# Altium schematic sheet Sheet.SchDoc
size A
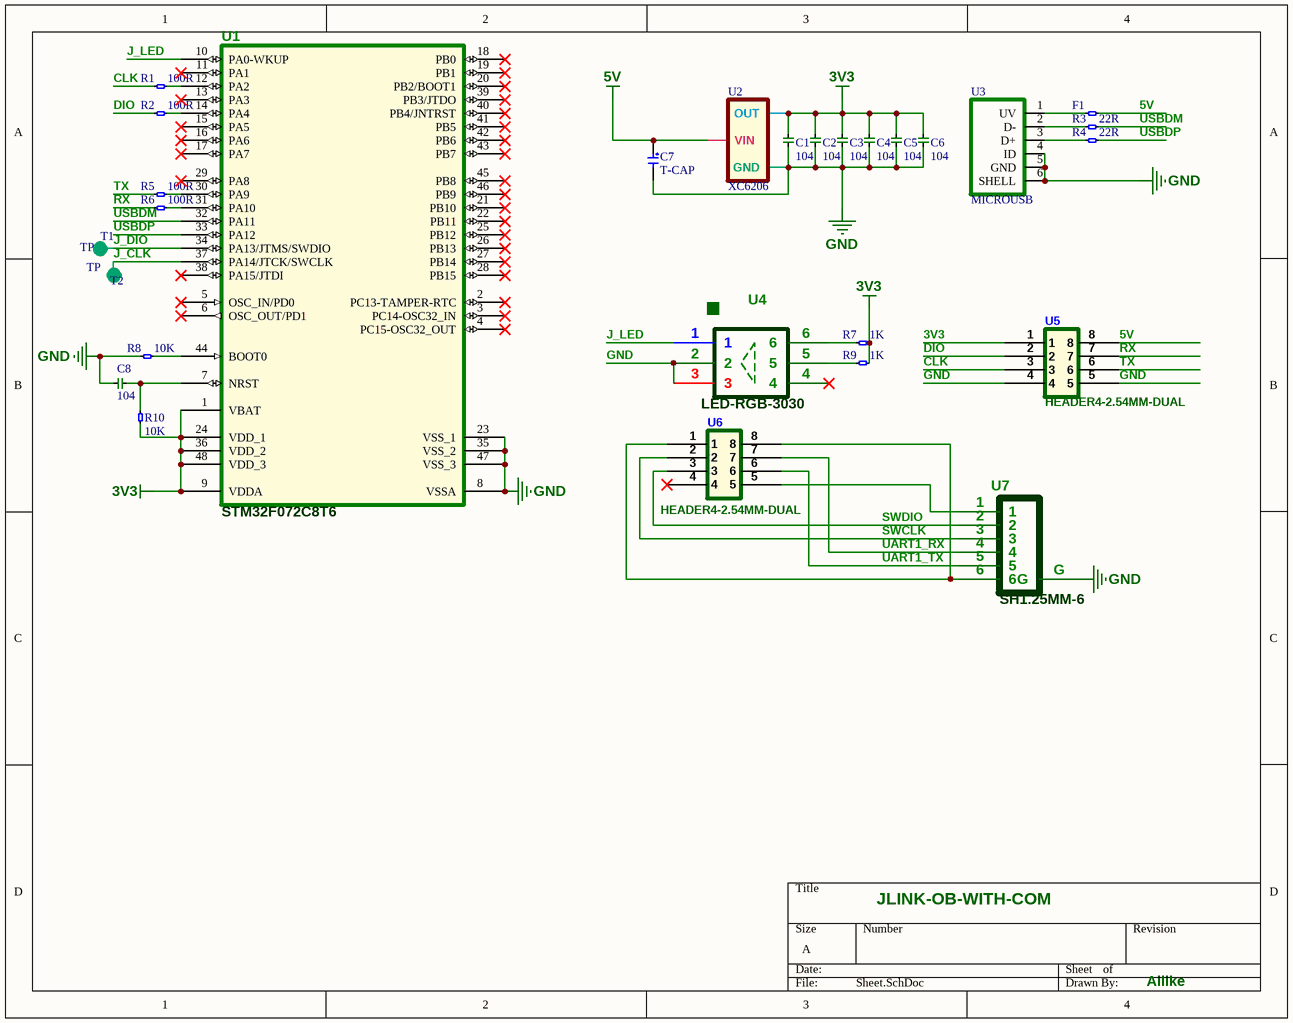
[diagram p0: Sheet.SchDoc]

## Parts
C1  104  [C0603]
C2  104  [C0603]
C3  104  [C0603]
C4  104  [C0603]
C5  104  [C0603]
C6  104  [C0603]
C7  T-CAP  [T-CAP-1206]
C8  104  [C0603]
F1  ?R  [R0603]  (value not drawn)
R1  100R  [R0603]
R2  100R  [R0603]
R3  22R  [R0603]
R4  22R  [R0603]
R5  100R  [R0603]
R6  100R  [R0603]
R7  1K  [R0603]
R8  10K  [R0603]
R9  1K  [R0603]
R10  10K  [R0603]
T1  TP  [TP]
T2  TP  [TP]
U1  STM32F072C8T6  [LQFP48P]
U2  XC6206  [XC6206]
U3  MICROUSB  [MICROUSB-DIP]
U4  LED-RGB-3030  [LED-RGB-PLCC6(3030)]
U5  HEADER4-2.54MM-DUAL  [HEADER4-2.54MM-BOTH]
U6  HEADER4-2.54MM-DUAL  [HEADER4-2.54MM-BOTH]
U7  SH1.25MM-6  [SH1.25MM-6PIN-VER]

## Nets
3V3: C1.2 C2.2 C3.2 C4.2 C5.2 C6.2 R7.2 R9.2 R10.1 U1.1(VBAT) U1.9(VDDA) U1.24(VDD_1) U1.36(VDD_2) U1.48(VDD_3) U2.3(OUT) U5.1
5V: C7.1 F1.2 U2.1(VIN) U5.8
GND: C1.1 C2.1 C3.1 C4.1 C5.1 C6.1 C7.2 C8.1 R8.1 U1.8(VSSA) U1.23(VSS_1) U1.35(VSS_2) U1.47(VSS_3) U2.2(GND) U3.4(ID) U3.5(GND) U3.6(SHELL) U4.2 U4.3 U5.4 U5.5 U7.G
CLK: R1.1 U5.3
DIO: R2.1 U5.2
J_CLK: T2.1 U1.37(PA14/JTCK/SWCLK)
J_DIO: T1.1 U1.34(PA13/JTMS/SWDIO)
J_LED: U1.10(PA0-WKUP) U4.1
RX: R6.1 U5.7
SWCLK: U6.2 U7.3
SWDIO: U6.3 U7.2
TX: R5.1 U5.6
UART1_RX: U6.7 U7.4
UART1_TX: U6.6 U7.5
USBDM: R3.2 U1.32(PA11)
USBDP: R4.2 U1.33(PA12)
NetC8_2: C8.2 R10.2 U1.7(NRST)
NetF1_1: F1.1 U3.1(UV)
NetR1_2: R1.2 U1.12(PA2)
NetR2_2: R2.2 U1.14(PA4)
NetR3_1: R3.1 U3.2(D-)
NetR4_1: R4.1 U3.3(D+)
NetR5_2: R5.2 U1.30(PA9)
NetR6_2: R6.2 U1.31(PA10)
NetR7_1: R7.1 U4.6
NetR8_2: R8.2 U1.44(BOOT0)
NetR9_1: R9.1 U4.5
NetU6_1: U6.1 U6.8 U7.6
NetU6_5: U6.5 U7.1

Not connected (* = marked no-connect by the designer): U1 2(PC13-TAMPER-RTC)* 3(PC14-OSC32_IN)* 4(PC15-OSC32_OUT)* 5(OSC_IN/PD0)* 6(OSC_OUT/PD1)* 11(PA1)* 13(PA3)* 15(PA5)* 16(PA6)* 17(PA7)* 18(PB0)* 19(PB1)* 20(PB2/BOOT1)* 21(PB10)* 22(PB11)* 25(PB12)* 26(PB13)* 27(PB14)* 28(PB15)* 29(PA8)* 38(PA15/JTDI)* 39(PB3/JTDO)* 40(PB4/JNTRST)* 41(PB5)* 42(PB6)* 43(PB7)* 45(PB8)* 46(PB9)*; U4 4*; U6 4*

## Notes on the sheet
- JLINK-OB-WITH-COM
- Ailike
- (in symbol LED-RGB-3030) .

## Library data of the parts
C1-C6 C8 = CAP
F1 R1-R10 = RES